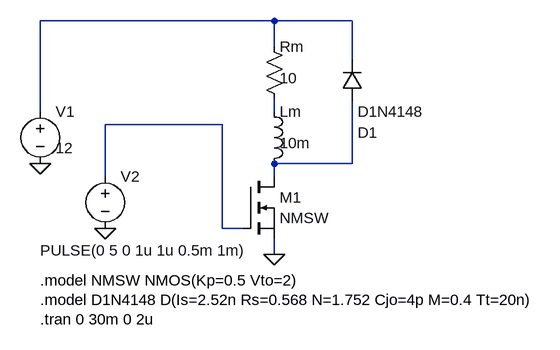
[diagram p0: schematic Ex10.asc]
Ex10.asc, the LTspice schematic file:
Version 4
SHEET 1 880 680
WIRE 80 180 80 40
WIRE 80 40 440 40
WIRE 440 40 440 80
WIRE 440 40 560 40
WIRE 560 40 560 100
WIRE 440 160 440 180
WIRE 440 260 440 280
WIRE 440 260 560 260
WIRE 560 260 560 164
WIRE 180 280 180 200
WIRE 180 200 360 200
WIRE 360 200 360 360
WIRE 360 360 392 360
WIRE 440 376 440 400
FLAG 80 260 0
FLAG 180 360 0
FLAG 440 400 0
SYMBOL voltage 80 164 R0
WINDOW 0 24 16 Left 2
WINDOW 3 24 72 Left 2
SYMATTR InstName V1
SYMATTR Value 12
SYMBOL voltage 180 264 R0
WINDOW 0 24 16 Left 2
WINDOW 3 -100 130 Left 2
SYMATTR InstName V2
SYMATTR Value PULSE(0 5 0 1u 1u 0.5m 1m)
SYMBOL res 424 64 R0
WINDOW 0 24 16 Left 2
WINDOW 3 24 64 Left 2
SYMATTR InstName Rm
SYMATTR Value 10
SYMBOL ind 424 164 R0
WINDOW 0 24 16 Left 2
WINDOW 3 24 64 Left 2
SYMATTR InstName Lm
SYMATTR Value 10m
SYMBOL diode 544 164 M180
WINDOW 0 24 -48 Left 2
WINDOW 3 24 -16 Left 2
SYMATTR InstName D1
SYMATTR Value D1N4148
SYMBOL nmos 392 280 R0
WINDOW 0 56 32 Left 2
WINDOW 3 56 64 Left 2
SYMATTR InstName M1
SYMATTR Value NMSW
TEXT 80 440 Left 2 !.model NMSW NMOS(Kp=0.5 Vto=2)
TEXT 80 470 Left 2 !.model D1N4148 D(Is=2.52n Rs=0.568 N=1.752 Cjo=4p M=0.4 Tt=20n)
TEXT 80 500 Left 2 !.tran 0 30m 0 2u

The netlist it stands for:
* Ex10.asc
V1 N001 0 12
V2 N004 0 PULSE(0 5 0 1u 1u 0.5m 1m)
Rm N001 N002 10
Lm N002 N003 10m
D1 N003 N001 D1N4148
M1 N003 N004 0 0 NMSW
.model D D
.lib standard.dio
.model NMOS NMOS
.model PMOS PMOS
.lib standard.mos
.model NMSW NMOS(Kp=0.5 Vto=2)
.model D1N4148 D(Is=2.52n Rs=0.568 N=1.752 Cjo=4p M=0.4 Tt=20n)
.tran 0 30m 0 2u
.backanno
.end